# Altium project Martin Transmitter.PrjPcb
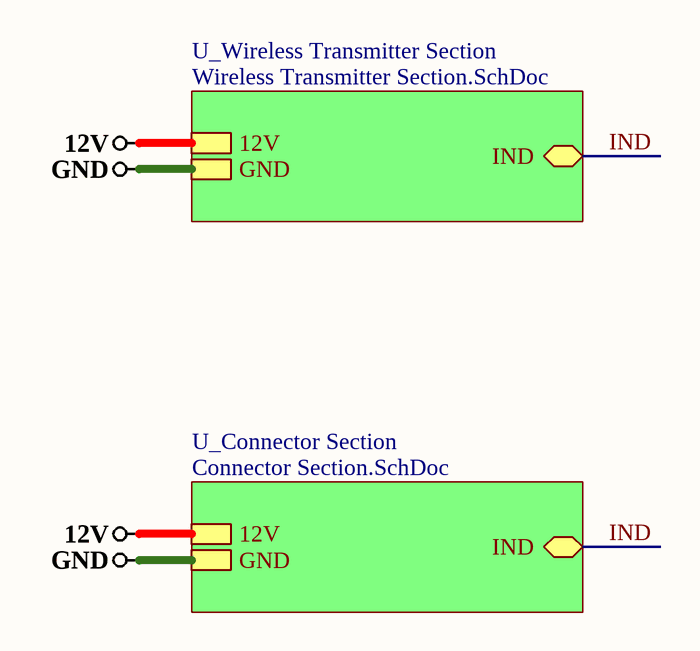
[diagram p0: Top Sheet.SchDoc]
3 sheets, 14 parts. Net scope: hierarchical (ports join the sheet entries above them; power ports are global).
Board file: MR_TRANS.PcbDoc
Sheets:
  Top Sheet.SchDoc
    U_Wireless Transmitter Section = Wireless Transmitter Section.SchDoc
    U_Connector Section = Connector Section.SchDoc

## Sheet Top Sheet.SchDoc
size A; DocumentNumber: 1; SheetNumber: 1; SheetTotal: 3

### Sub-sheets
U_Connector Section = Connector Section.SchDoc: IND (bidir), 12V, GND
U_Wireless Transmitter Section = Wireless Transmitter Section.SchDoc: IND (bidir), 12V, GND

### Nets
12V: sheet U_Wireless Transmitter Section/12V, sheet U_Connector Section/12V
GND: sheet U_Wireless Transmitter Section/GND, sheet U_Connector Section/GND
IND: sheet U_Wireless Transmitter Section/IND, sheet U_Connector Section/IND

## Sheet Wireless Transmitter Section.SchDoc
size A; DocumentNumber: 2; SheetNumber: 2; SheetTotal: 3
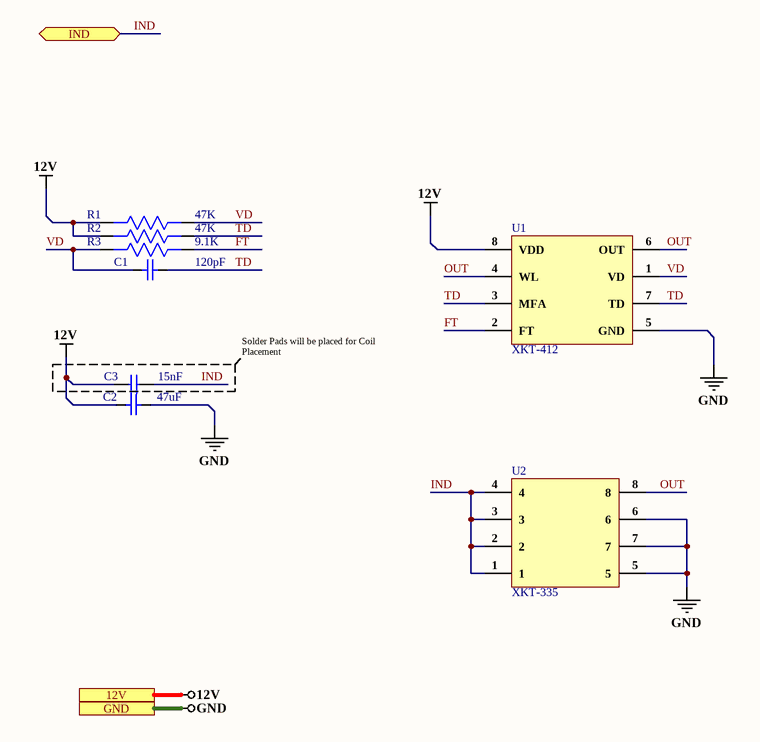
[diagram p1: Wireless Transmitter Section.SchDoc]

### Parts
C1  120pF  [CAP 0201]
C2  47uF  [Cap1206]
C3  15nF  [CAP 0201]
R1  47K  [Res-0201]
R2  47K  [Res-0201]
R3  9.1K  [Res-0201]
U1  XKT-412  [SOP-8]
U2  XKT-335  [SOP-8]

### Ports
12V, GND, IND (bidir)

### Nets
12V: C2.2 C3.1 R1.2 R2.2 U1.8(VDD) ; port 12V
GND: C2.1 U1.5(GND) U2.5 U2.6 U2.7 ; port GND
FT: R3.1 U1.2(FT)
IND: C3.2 U2.1 U2.2 U2.3 U2.4 ; port IND
OUT: U1.4(WL) U1.6(OUT) U2.8
TD: C1.1 R2.1 U1.3(MFA) U1.7(TD)
VD: C1.2 R1.1 R3.2 U1.1(VD)

### Notes on the sheet
- Solder Pads will be placed for Coil Placement

### Library data of the parts
C1 = GRM0335C1H121JA01D: CAP CER 120PF 50V C0G/NP0 0201; Manufacturer: Murata; Tolerance: 5%; Dielectric: C0G; Supplier 1: Digi-Key; Manufacturer Part Number: GRM0335C1H121JA01D; RoHS: Yes; Category: Ceramic Capacitors; Stock 1: 655537; Pricing 1: 1=0.10000, 10=0.02300, 50=0.01260, 100=0.01020, 500=0.00732, 1000=0.00575, 2500=0.00522, 5000=0.00481 (USD); Mount: Surface Mount; Case/Package: 0201; Case Code (Imperial): 0201; Case Code (Metric): 0603; Weight: 1.2E-05oz; Min Operating Temperature: -55°C; Max Operating Temperature: 125°C; Capacitance: 120pF; Voltage Rating (DC): 50V; Packaging: Tape and Reel; Package Quantity: 15000; Voltage Rating: 50V; Termination: SMD/SMT; Length: 0.024inch; Width: 0.3mm; Height: 0.3mm; Thickness: 0.013inch; Lead Free: Lead Free; RoHS Compliant: Yes; ComponentLink1URL: https://datasheet.ciiva.com/18699/grm0335c1h121ja01-01-18699256.pdf?src-supplier=Digi-Key; ComponentLink1Description: https://datasheet.ciiva.com/18699/grm0335c1h121ja01-01-18699256.pdf?src-supplier=Digi-Key; ComponentLink2URL: https://datasheet.ciiva.com/24220/c02e-24220870.pdf?src-supplier=Mouser; ComponentLink2Description: https://datasheet.ciiva.com/24220/c02e-24220870.pdf?src-supplier=Mouser; ComponentLink3URL: https://datasheet.ciiva.com/18699/partnumbering-e-01-18699257.pdf?src-supplier=Digi-Key; ComponentLink3Description: https://datasheet.ciiva.com/18699/partnumbering-e-01-18699257.pdf?src-supplier=Digi-Key; ComponentLink4URL: https://datasheet.ciiva.com/18699/partnumbering-e-01-18699258.pdf?src-supplier=Digi-Key; ComponentLink4Description: https://datasheet.ciiva.com/18699/partnumbering-e-01-18699258.pdf?src-supplier=Digi-Key; Supplier Part Number 1: 490-7221-1-ND
C2 = EMK316BBJ476ML-T: CAP CER 47UF 16V X5R 1206; Manufacturer: Taiyo Yuden; Tolerance: 20%; Supplier 1: Digi-Key; Manufacturer Part Number: EMK316BBJ476ML-T; RoHS: Yes; Category: Ceramic Capacitors; Stock 1: 201307; Pricing 1: 1=0.70000, 10=0.51700, 50=0.41400, 100=0.35480, 500=0.28090, 1000=0.23654 (USD); Mount: Surface Mount; Case/Package: 1206; Case Code (Imperial): 1206; Case Code (Metric): 3216; Min Operating Temperature: -55°C; Max Operating Temperature: 85°C; Packaging: Tape and Reel; Capacitance: 47uF; Voltage Rating: 16V; RoHS Compliant: Yes; ComponentLink1URL: http://www.farnell.com/datasheets/2819853.pdf?src-supplier=Farnell; ComponentLink1Description: http://www.farnell.com/datasheets/2819853.pdf?src-supplier=Farnell; ComponentLink2URL: http://ds.yuden.co.jp/TYCOMPAS/ut/detail.do?productNo=EMK316BBJ476ML-T&fileName=EMK316BBJ476ML-T_SS&mode=specSheetDownload&src-supplier=Digi-Key; ComponentLink2Description: http://ds.yuden.co.jp/TYCOMPAS/ut/detail.do?productNo=EMK316BBJ476ML-T&fileName=EMK316BBJ476ML-T_SS&mode=specSheetDownload&src-supplier=Digi-Key; ComponentLink3URL: http://www.farnell.com/datasheets/2819853.pdf?src-supplier=Element14; ComponentLink3Description: http://www.farnell.com/datasheets/2819853.pdf?src-supplier=Element14; ComponentLink4URL: http://www.farnell.com/datasheets/2819853.pdf?src-supplier=Newark; ComponentLink4Description: http://www.farnell.com/datasheets/2819853.pdf?src-supplier=Newark; Supplier Part Number 1: 587-5425-1-ND
C3 = CC0201KRX7R8BB152: CAP CER 1500PF 25V X7R 0201; Manufacturer: Yageo; Capacitance: 1.5nF; Tolerance: 10%; Supplier 1: Digi-Key; Manufacturer Part Number: CC0201KRX7R8BB152; RoHS: Yes; Category: Ceramic Capacitors; Stock 1: 17556; Pricing 1: 1=0.10000, 10=0.02400, 50=0.01320, 100=0.01080, 500=0.00770, 1000=0.00605, 2500=0.00550, 5000=0.00506 (USD); Mount: Surface Mount; Case/Package: 0201; Case Code (Metric): 0603; Case Code (Imperial): 0201; Min Operating Temperature: -55°C; Max Operating Temperature: 125°C; Packaging: Tape and Reel; Voltage Rating: 25V; Voltage Rating (DC): 25V; Dielectric: X7R; Length: 0.024inch; Width: 0.012inch; Thickness: 0.013inch; Lead Free: Lead Free; Halogen Free: Halogen Free; RoHS Compliant: Yes; ComponentLink1URL: http://www.yageo.com/documents/recent/UPY-GPHC_X7R_6.3V-to-50V_18.pdf?src-supplier=Digi-Key; ComponentLink1Description: http://www.yageo.com/documents/recent/UPY-GPHC_X7R_6.3V-to-50V_18.pdf?src-supplier=Digi-Key; Supplier Part Number 1: 311-1607-1-ND
R1 R2 = ERJ-1GNJ473C: RES SMD 47K OHM 5% 1/20W 0201; Manufacturer: Panasonic; Resistance: 47kR; Power Rating: 50mW; Voltage Rating: 25V; Temperature Coefficient: 200ppm/°C; Supplier 1: Digi-Key; Manufacturer Part Number: ERJ-1GNJ473C; RoHS: Yes; Category: Chip SMD Resistors; Stock 1: 79259; Pricing 1: 1=0.10000, 10=0.02500, 100=0.01000, 1000=0.00450, 2500=0.00391, 5000=0.00323 (USD); Mount: Surface Mount; Case/Package: 0201; Case Code (Imperial): 0201; Case Code (Metric): 0603; Min Operating Temperature: -55°C; Max Operating Temperature: 125°C; Packaging: Tape and Reel; Tolerance: 5%; Package Quantity: 15000; Resistor Type: Thick Film; Number of Terminations: 2; Max Power Dissipation: 50mW; Termination: SMD/SMT; Length: 0.024inch; Width: 0.3mm; Height: 0.01inch; RoHS Compliant: Yes; ComponentLink1URL: https://datasheet.ciiva.com/24066/aoa0000ce1-37422-24066854.pdf?src-supplier=Mouser; ComponentLink1Description: https://datasheet.ciiva.com/24066/aoa0000ce1-37422-24066854.pdf?src-supplier=Mouser; Supplier Part Number 1: P123333CT-ND
R3 = RC0201JR-079K1L: RES SMD 9.1K OHM 5% 1/20W 0201; Manufacturer: Yageo; Power Rating: 50mW; Resistance: 9.1kR; Temperature Coefficient: 200ppm/°C; Working Voltage: 25V; Supplier 1: Digi-Key; Manufacturer Part Number: RC0201JR-079K1L; RoHS: Yes; Category: Chip SMD Resistors; Stock 1: 4033; Pricing 1: 1=0.10000, 10=0.02800, 100=0.01140, 1000=0.00513, 2500=0.00445, 5000=0.00368 (USD); Case/Package: 0201; Case Code (Metric): 0603; Case Code (Imperial): 0201; Min Operating Temperature: -55°C; Max Operating Temperature: 125°C; Packaging: Tape and Reel; Number of Terminations: 2; Resistor Type: Thick Film; Tolerance: 5%; Max Power Dissipation: 50mW; Features: Moisture Resistant; Length: 0.024inch; Width: 0.012inch; Height: 0.01inch; Lead Free: Lead Free; ComponentLink1URL: http://www.yageo.com/documents/recent/PYu-RC_Group_51_RoHS_L_9.pdf?src-supplier=Digi-Key; ComponentLink1Description: http://www.yageo.com/documents/recent/PYu-RC_Group_51_RoHS_L_9.pdf?src-supplier=Digi-Key; ComponentLink2URL: http://www.yageo.com.tw/exep/pages/download/literatures/PYu-R_INT-thick_7.pdf?src-supplier=Digi-Key; ComponentLink2Description: http://www.yageo.com.tw/exep/pages/download/literatures/PYu-R_INT-thick_7.pdf?src-supplier=Digi-Key; ComponentLink3URL: http://www.yageo.com/documents/recent/PYu-RC_Group_51_RoHS_L_8.pdf?src-supplier=Future+Electronics; ComponentLink3Description: http://www.yageo.com/documents/recent/PYu-RC_Group_51_RoHS_L_8.pdf?src-supplier=Future+Electronics; Supplier Part Number 1: YAG2941CT-ND
U1 = XKT-412: 1.5AUSB power chip wireless wireless charging power; Manufacturer: ReYeBu; Value: Custom; Manufacturer Part No: XKT-412; Package: SOP-8
U2 = XKT-335: high current wireless power charging power wireless IC chip; Manufacturer: ReYeBu; Value: Custom; Manufacturer Part No: XKT-335; Pakage: SOP-8

## Sheet Connector Section.SchDoc
size A; DocumentNumber: 3; SheetNumber: 3; SheetTotal: 3
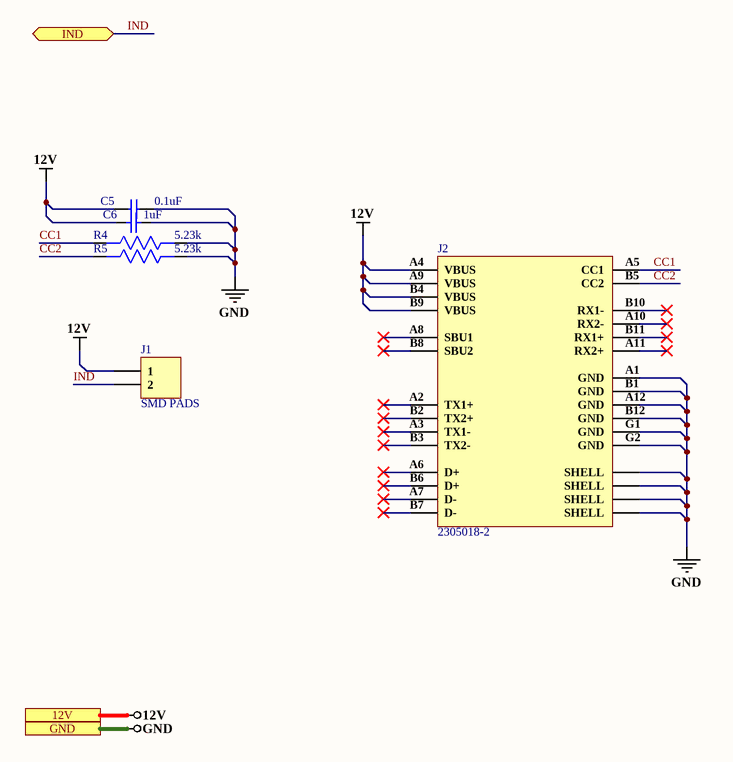
[diagram p2: Connector Section.SchDoc]

### Parts
C5  0.1uF  [CAP 0201]
C6  1uF  [Cap0402]
J1  SMD PADS  [SMD PAD]
J2  2305018-2  [2305018-2]
R4  5.23k  [Res-0201]
R5  5.23k  [Res-0201]

### Ports
12V, GND, IND (bidir)

### Nets
12V: C5.1 C6.2 J1.1 J2.A4(VBUS) J2.A9(VBUS) J2.B4(VBUS) J2.B9(VBUS) ; port 12V
GND: C5.2 C6.1 J2.A1(GND) J2.A12(GND) J2.B1(GND) J2.B12(GND) J2.G1(GND) J2.G2(GND) J2.S1(SHELL) J2.S2(SHELL) J2.S3(SHELL) J2.S4(SHELL) R4.1 R5.1 ; port GND
CC1: J2.A5(CC1) R4.2
CC2: J2.B5(CC2) R5.2
IND: J1.2 ; port IND

Not connected (* = marked no-connect by the designer): J2 A2(TX1+)* A3(TX1-)* A6(D+)* A7(D-)* A8(SBU1)* A10(RX2-)* A11(RX2+)* B2(TX2+)* B3(TX2-)* B6(D+)* B7(D-)* B8(SBU2)* B10(RX1-)* B11(RX1+)*

### Library data of the parts
C5 = GRM033R6YA104ME14D: CAP CER 0.1UF 35V X5R 0201; Manufacturer: Murata; Tolerance: 20%; Capacitance: 100nF; Supplier 1: Digi-Key; Manufacturer Part Number: GRM033R6YA104ME14D; RoHS: Yes; Category: Ceramic Capacitors; Stock 1: 49800; Pricing 1: 1=0.10000, 10=0.05600, 50=0.03040, 100=0.02490, 500=0.01778, 1000=0.01398, 2500=0.01270, 5000=0.01169 (USD); Mount: Surface Mount; Case/Package: 0201; Weight: 1.2E-05oz; Case Code (Metric): 0603; Case Code (Imperial): 0201; Min Operating Temperature: -55°C; Max Operating Temperature: 85°C; Dielectric: X5R; Termination: SMD/SMT; Voltage Rating (DC): 35V; Package Quantity: 15000; Packaging: Tape and Reel; Voltage Rating: 35V; Length: 0.024inch; Height: 0.3mm; Width: 0.012inch; Thickness: 0.013inch; ComponentLink1URL: http://www.mouser.com/ds/2/281/c02e-2905.pdf?src-supplier=Mouser; ComponentLink1Description: http://www.mouser.com/ds/2/281/c02e-2905.pdf?src-supplier=Mouser; ComponentLink2URL: http://search.murata.co.jp/Ceramy/image/img/A01X/G101/ENG/GRM033R6YA104ME14-01.pdf?src-supplier=Digi-Key; ComponentLink2Description: http://search.murata.co.jp/Ceramy/image/img/A01X/G101/ENG/GRM033R6YA104ME14-01.pdf?src-supplier=Digi-Key; Supplier Part Number 1: 490-10431-1-ND
C6 = CC0402KRX5R6BB105: CAP CER 1UF 10V X5R 0402; Manufacturer: Yageo; Tolerance: 10%; Dissipation Factor: 15%; Supplier 1: Digi-Key; Manufacturer Part Number: CC0402KRX5R6BB105; RoHS: Yes; Category: Ceramic Capacitors; Stock 1: 3784314; Pricing 1: 1=0.11000, 10=0.08000, 50=0.04560, 100=0.03770, 500=0.02644, 1000=0.02189, 2500=0.02037, 5000=0.01864 (USD); Mount: Surface Mount; Case/Package: 0402; Number of Pins: 2; Case Code (Metric): 1005; Case Code (Imperial): 0402; Min Operating Temperature: -55°C; Max Operating Temperature: 85°C; Capacitance: 1uF; Dielectric: X5R; Package Quantity: 1; Voltage Rating: 10V; Packaging: Tape and Reel; Voltage Rating (DC): 10V; Termination: SMD/SMT; Resistor Type: Ceramic; Series: CC; Construction: Flat; Length: 1mm; Width: 0.02inch; Height: 0.5mm; Thickness: 0.022inch; Depth: 0.5mm; Radiation Hardening: No; REACH SVHC: No SVHC; Lead Free: Lead Free; Halogen Free: Halogen Free; RoHS Compliant: Yes; ComponentLink1URL: https://datasheet.ciiva.com/176/upy-gphc-x5r-4v-to-50v-12-176704.pdf?src-supplier=Digi-Key; ComponentLink1Description: https://datasheet.ciiva.com/176/upy-gphc-x5r-4v-to-50v-12-176704.pdf?src-supplier=Digi-Key; ComponentLink2URL: https://datasheet.ciiva.com/176/mlccorderingcode-176705.pdf?src-supplier=Digi-Key; ComponentLink2Description: https://datasheet.ciiva.com/176/mlccorderingcode-176705.pdf?src-supplier=Digi-Key; ComponentLink3URL: https://datasheet.ciiva.com/176/mlccorderingcode-176706.pdf?src-supplier=Digi-Key; ComponentLink3Description: https://datasheet.ciiva.com/176/mlccorderingcode-176706.pdf?src-supplier=Digi-Key; Supplier Part Number 1: 311-1439-1-ND
J1 = SMD PAD
J2 = 2305018-2: CONN RCP USB3.1 TYPEC 24P SMD RA
R4 R5 = RTT015231FTH: 5.23kΩ ±1% 0.05W 0201 Chip Resistor - Surface Mount RoHS; Manufacturer: Ralec; Manufacturer Part No: RTT015231FTH; Package: 0201; Value: 5.23k

## Nets that join several sheets
12V: Wireless Transmitter Section (5 pins), Connector Section (7 pins)
GND: Wireless Transmitter Section (5 pins), Connector Section (14 pins)
IND: Wireless Transmitter Section (5 pins), Connector Section (J1.2)